# Altium project RK3566_.PrjPcb (part 3 of 6)

## Sheet WIFI_BT PHY.schdoc
size 297 x 209 mm; Symbol: Drawing-Symbol_A4; Company: 嘉立创EDA; Version: V1.0; Page Size: A4; @Project Name: RK3566; @Update Date: 2026-10-03; @Create Date: 2026-05-22; Device: Drawing-Symbol_A4; @Board Name: Board1; @Page Name: P2; @Create Time: 17:39:22; @Page Count: 4; @Page No: 4; @Schematic Name: Schematic1; @Update Time: 17:39:22; @Assembly Variant: Basic; Border: 1; Title Block Position: 3; Size: A4; Width: 1170; Height: 825; Region Start: 1; X Region Count: 6; Y Region Count: 4; Blade Width: 10; SheetNumber: 6; SheetTotal: 11
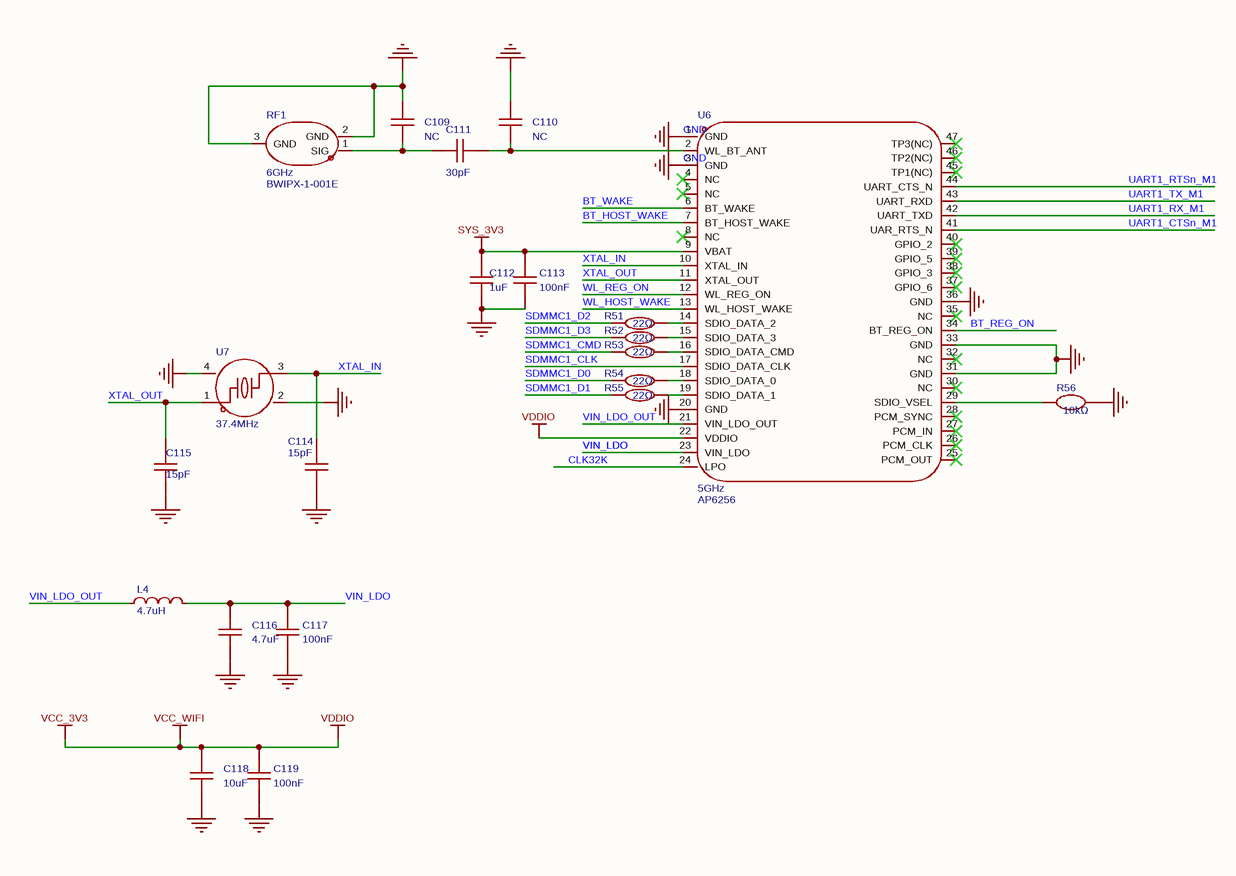
[diagram p6: WIFI_BT PHY.schdoc]

### Parts
C109  NC  [C0402]
C110  NC  [C0402]
C111  30pF  [C0402]
C112  1uF  [C0402]
C113  100nF  [C0402]
C114  15pF  [C0402]
C115  15pF  [C0402]
C116  4.7uF  [C0402]
C117  100nF  [C0402]
C118  10uF  [C0402]
C119  100nF  [C0402]
L4  4.7uH  [L0805]
R51  22Ω  [R0402]
R52  22Ω  [R0402]
R53  22Ω  [R0402]
R54  22Ω  [R0402]
R55  22Ω  [R0402]
R56  10kΩ  [R0402]
RF1  6GHz  [IPEX-SMD_BWIPX-1-001E]
U6  5GHz  [QFN-44_L12.0-W12.0-P0.90-TL_AP6256]
U7  37.4MHz  [OSC-SMD_4P-L1.6-W1.2-BL-1]

### Nets
GND: C109.2 C110.2 C112.1 C113.1 C114.1 C115.1 C116.1 C117.1 C118.1 C119.1 R56.2 RF1.2(GND) RF1.3(GND) U6.1(GND) U6.3(GND) U6.20(GND) U6.31(GND) U6.33(GND) U6.36(GND) U7.2(GND) U7.4(GND)  [project net AVSS1_1]
SYS_3V3: C112.2 C113.2 U6.9(VBAT)
VCC_3V3: C118.2 C119.2 U6.22(VDDIO)  [also labelled VCC_WIFI, VDDIO]  [project net SWOUT1]
BT_HOST_WAKE: U6.7(BT_HOST_WAKE)
BT_REG_ON: U6.34(BT_REG_ON)
BT_WAKE: U6.6(BT_WAKE)
CLK32K: U6.24(LPO)
SDMMC1_CLK: U6.17(SDIO_DATA_CLK)
SDMMC1_CMD: R53.1
SDMMC1_D0: R54.1
SDMMC1_D1: R55.1
SDMMC1_D2: R51.1
SDMMC1_D3: R52.1
UART1_CTSn_M1: U6.41(UAR_RTS_N)
UART1_RTSn_M1: U6.44(UART_CTS_N)
UART1_RX_M1: U6.42(UART_TXD)
UART1_TX_M1: U6.43(UART_RXD)
VIN_LDO: C116.2 C117.2 L4.2 U6.23(VIN_LDO)
VIN_LDO_OUT: L4.1 U6.21(VIN_LDO_OUT)
WL_HOST_WAKE: U6.13(WL_HOST_WAKE)
WL_REG_ON: U6.12(WL_REG_ON)
XTAL_IN: C114.2 U6.10(XTAL_IN) U7.3
XTAL_OUT: C115.2 U6.11(XTAL_OUT) U7.1
NetC109_1: C109.1 C111.1 RF1.1(SIG)
NetC110_1: C110.1 C111.2 U6.2(WL_BT_ANT)
NetR51_2: R51.2 U6.14(SDIO_DATA_2)
NetR52_2: R52.2 U6.15(SDIO_DATA_3)
NetR53_2: R53.2 U6.16(SDIO_DATA_CMD)
NetR54_2: R54.2 U6.18(SDIO_DATA_0)
NetR55_2: R55.2 U6.19(SDIO_DATA_1)
NetR56_1: R56.1 U6.29(SDIO_VSEL)

Not connected (* = marked no-connect by the designer): U6 4(NC)* 5(NC)* 8(NC)* 25(PCM_OUT)* 26(PCM_CLK)* 27(PCM_IN)* 28(PCM_SYNC)* 30(NC)* 32(NC)* 35(NC)* 37(GPIO_6)* 38(GPIO_3)* 39(GPIO_5)* 40(GPIO_2)* 45(TP1(NC))* 46(TP2(NC))* 47(TP3(NC))*

### Notes on the sheet
- 创建日期
- 2026-10-03
- 原理图
- 板子
- Schematic1
- Board1
- 更新日期
- 图页
- P2
- 绘制
- 审阅
- RK3566
- 版本
- V1.0
- 尺寸
- A4
- 页    4    共    4
- 嘉立创EDA

### Library data of the parts
C109 C110 = CC0402JRNPO9BN100: 容值:10pF;精度:±5%;额定电压:50V;温度系数:NP0;; Manufacturer: YAGEO(国巨); AddInBom: yes; ModelId: 36a51122f27c49738f86b3bfa98863e0聨0819f05c4eef4c71ace90d822a990e87; ModelName: C0402_L1.0-W0.5-H0.5; ModelTransform: 39.37,19.685,0,0,0,0,0,0,0; Tolerance: ±5%; Voltage Rating: 50V; Temperature Coefficient: NP0; Symbol: CC0402JRNPO9BN100; Device: CC0402JRNPO9BN100; Value: NC; LCSC Part Name: 10pF ±5% 50V; ManufacturerPart: CC0402JRNPO9BN100; Supplier Footprint: 0402; JLCPCB Part Class: Extended Part; Datasheet: https://item.szlcsc.com/datasheet/CC0402JRNPO9BN100/107414.html; Supplier: LCSC; ConvertToPcb: yes; FootprintName: C0402
C111 = CC0402FRNPO9BN300: 容值:30pF;精度:±1%;额定电压:50V;材质(温度系数):NP0;; Manufacturer: YAGEO(国巨); AddInBom: yes; ModelId: 36a51122f27c49738f86b3bfa98863e0聨0819f05c4eef4c71ace90d822a990e87; ModelName: C0402_L1.0-W0.5-H0.5; ModelTransform: 39.37,19.685,0,0,0,0,0,0,0; Tolerance: ±1%; Voltage Rated: 50V; Temperature Coefficient: NP0; Symbol: CC0402FRNPO9BN300; Device: CC0402FRNPO9BN300; LCSC Part Name: 30pF ±1% 50V; SupplierPart: C526980; ManufacturerPart: CC0402FRNPO9BN300; Supplier Footprint: 0402; JLCPCB Part Class: Extended Part; Datasheet: https://atta.szlcsc.com/upload/public/pdf/source/20200508/C526980_8BD9B2380CFF3BD9993DEB032B356E9B.pdf; Supplier: LCSC; ConvertToPcb: yes; FootprintName: C0402; Value: 30pF
C112 = HGC0402R5105K500NTEJ: 容值:1uF;精度:±10%;额定电压:50V;温度系数:X5R;; Manufacturer: Chinocera(华瓷); 3D Model: 36a51122f27c49738f86b3bfa98863e0聨0819f05c4eef4c71ace90d822a990e87; 3D Model Transform: 39.37,19.685,0,0,0,0,0,0,0; Tolerance: ±10%; Voltage Rating: 50V; Temperature Coefficient: X5R; AddInBom: yes; ModelName: C0402_L1.0-W0.5-H0.5; Symbol: HGC0402R5105K500NTEJ; Device: HGC0402R5105K500NTEJ; LCSC Part Name: 1uF ±10% 50V; Supplier Part: C7472948; Manufacturer Part: HGC0402R5105K500NTEJ; Supplier Footprint: 0402; JLCPCB Part Class: Extended Part; Datasheet: https://item.szlcsc.com/datasheet/HGC0402R5105K500NTEJ/8532795.html; Supplier: LCSC; Value: 1uF; ConvertToPcb: yes; FootprintName: C0402
C113 C117 C119 = CL05B104KO5NNNC: 容值:100nF;精度:±10%;额定电压:16V;温度系数:X7R;; Manufacturer: SAMSUNG(三星); 3D Model: 36a51122f27c49738f86b3bfa98863e0聨0819f05c4eef4c71ace90d822a990e87; 3D Model Transform: 39.37,19.685,0,0,0,0,0,0,0; Tolerance: ±10%; Voltage Rating: 16V; Temperature Coefficient: X7R; AddInBom: yes; ModelName: C0402_L1.0-W0.5-H0.5; Symbol: CL05B104KO5NNNC; Device: CL05B104KO5NNNC; LCSC Part Name: 100nF ±10% 16V; Supplier Part: C1525; Manufacturer Part: CL05B104KO5NNNC; Supplier Footprint: 0402; JLCPCB Part Class: Basic Part; Datasheet: https://item.szlcsc.com/datasheet/CL05B104KO5NNNC/1877.html; Supplier: LCSC; Value: 100nF; ConvertToPcb: yes; FootprintName: C0402
C114 C115 = CC0402FRNPO9BN150: 容值:15pF;精度:±1%;额定电压:50V;温度系数:NP0;; Manufacturer: YAGEO(国巨); AddInBom: yes; ModelId: 36a51122f27c49738f86b3bfa98863e0聨0819f05c4eef4c71ace90d822a990e87; ModelName: C0402_L1.0-W0.5-H0.5; ModelTransform: 39.37,19.685,0,0,0,0,0,0,0; Tolerance: ±1%; Voltage Rating: 50V; Temperature Coefficient: NP0; Symbol: CC0402FRNPO9BN150; Device: CC0402FRNPO9BN150; LCSC Part Name: 15pF ±1% 50V; SupplierPart: C326803; ManufacturerPart: CC0402FRNPO9BN150; Supplier Footprint: 0402; JLCPCB Part Class: Extended Part; Datasheet: https://item.szlcsc.com/datasheet/CC0402FRNPO9BN150/306897.html; Supplier: LCSC; ConvertToPcb: yes; FootprintName: C0402; Value: 15pF
C116 = CGA0402X5R475M250GT: 容值:4.7uF;精度:±20%;额定电压:25V;温度系数:X5R;; Manufacturer: HRE(芯声); AddInBom: yes; ModelId: 36a51122f27c49738f86b3bfa98863e0聨0819f05c4eef4c71ace90d822a990e87; ModelName: C0402_L1.0-W0.5-H0.5; ModelTransform: 39.37,19.685,0,0,0,0,0,0,0; Tolerance: ±20%; Voltage Rating: 25V; Temperature Coefficient: X5R; Symbol: CGA0402X5R475M250GT; Device: CGA0402X5R475M250GT; LCSC Part Name: 4.7uF ±20% 25V; SupplierPart: C6119795; ManufacturerPart: CGA0402X5R475M250GT; Supplier Footprint: 0402; JLCPCB Part Class: Extended Part; Datasheet: https://item.szlcsc.com/datasheet/CGA0402X5R475M250GT/7062501.html; Supplier: LCSC; ConvertToPcb: yes; FootprintName: C0402; Value: 4.7uF
C118 = HGC0402R5106M100NTEJ: 容值:10uF;精度:±20%;额定电压:10V;温度系数:X5R;; Manufacturer: Chinocera(华瓷); 3D Model: 36a51122f27c49738f86b3bfa98863e0聨0819f05c4eef4c71ace90d822a990e87; 3D Model Transform: 39.37,19.685,0,0,0,0,0,0,0; Tolerance: ±20%; Voltage Rating: 10V; Temperature Coefficient: X5R; AddInBom: yes; ModelName: C0402_L1.0-W0.5-H0.5; Symbol: HGC0402R5106M100NTEJ; Device: HGC0402R5106M100NTEJ; LCSC Part Name: 10uF ±20% 10V; Supplier Part: C7472949; Manufacturer Part: HGC0402R5106M100NTEJ; Supplier Footprint: 0402; JLCPCB Part Class: Extended Part; Datasheet: https://item.szlcsc.com/datasheet/HGC0402R5106M100NTEJ/8532796.html; Supplier: LCSC; Value: 10uF; ConvertToPcb: yes; FootprintName: C0402
L4 = MPL2012S4R7MHT: 电感值:4.7uH;精度:±20%;额定电流:800mA;类型:叠层电感;; Manufacturer: Sunlord(顺络); AddInBom: yes; ModelId: 37a81e68749a4138bd2dfa6897b24b85聨0819f05c4eef4c71ace90d822a990e87; ModelName: R0805_L2.0-W1.3-H0.6; ModelTransform: 78.74,51.181,0,0,0,0,0,0.001,0; Tolerance: ±20%; Current Rating: 800mA; DC Resistance(DCR): 250mΩ; Type: 叠层电感; Symbol: MPL2012S4R7MHT; Device: MPL2012S4R7MHT; LCSC Part Name: 4.7uH ±20%; SupplierPart: C63166; ManufacturerPart: MPL2012S4R7MHT; Supplier Footprint: 0805; JLCPCB Part Class: Extended Part; Datasheet: https://item.szlcsc.com/datasheet/MPL2012S4R7MHT/64229.html; Supplier: LCSC; ConvertToPcb: yes; FootprintName: L0805; Value: 4.7uH
R51-R55 = RC0402FR-0722RL: 电阻类型:厚膜电阻;阻值:22Ω;精度:±1%;功率:62.5mW;工作电压:50V;温度系数:±100ppm/℃;; Manufacturer: YAGEO(国巨); 3D Model: 98c88bc2b9094f218f3a3e30a7012738聨0819f05c4eef4c71ace90d822a990e87; 3D Model Transform: 39.37,19.685,0,0,0,0,0,0,0; Tolerance: ±1%; Power(Watts): 62.5mW; Voltage-Supply(Max): 50V; AddInBom: yes; ModelName: R0402_L1.0-W0.5-H0.4; Symbol: RC0402FR-0722RL; Device: RC0402FR-0722RL; LCSC Part Name: 厚膜电阻 22Ω ±1% 62.5mW; Supplier Part: C114765; Manufacturer Part: RC0402FR-0722RL; Supplier Footprint: 0402; JLCPCB Part Class: Extended Part; Datasheet: https://item.szlcsc.com/datasheet/RC0402FR-0722RL/116009.html; Supplier: LCSC; Type: 厚膜电阻; Value: 22Ω; Temperature Coefficient: ±100ppm/℃; Operating Temperature: -55℃~+155℃; ConvertToPcb: yes; FootprintName: R0402
R56 = FRC0402F1002TS: 电阻类型:厚膜电阻;阻值:10kΩ;精度:±1%;功率:62.5mW;工作电压:50V;温度系数:±100ppm/℃;; Manufacturer: FOJAN(富捷); AddInBom: yes; ModelId: 98c88bc2b9094f218f3a3e30a7012738聨0819f05c4eef4c71ace90d822a990e87; ModelName: R0402_L1.0-W0.5-H0.4; ModelTransform: 39.37,19.685,0,0,0,0,0,0,0; Tolerance: ±1%; Power(Watts): 62.5mW; Voltage-Supply(Max): 50V; Symbol: FRC0402F1002TS; Device: FRC0402F1002TS; LCSC Part Name: 10kΩ ±1% 62.5mW 厚膜电阻; SupplierPart: C2906861; ManufacturerPart: FRC0402F1002TS; Supplier Footprint: 0402; JLCPCB Part Class: Extended Part; Datasheet: https://item.szlcsc.com/datasheet/FRC0402F1002TS/3180374.html; Supplier: LCSC; ConvertToPcb: yes; FootprintName: R0402; Type: 厚膜电阻; Value: 10kΩ; Temperature Coefficient: ±100ppm/℃; Operating Temperature: -55℃~+155℃
RF1 = BWIPX-1-001E: 连接器类型:板端;接口类型:内针;端口数量:1;接口直径:2mm;接口长度/高度:1.25mm;频率:6GHz;射频系列:IPEX;阻抗:50Ω;样式:-;工作温度:-40℃~+85℃;; Manufacturer: BAT WIRELESS(蝙蝠无线); AddInBom: yes; ModelId: e9910d1cc3f644ef905f39c3184653d7聨0819f05c4eef4c71ace90d822a990e87; ModelTransform: 122.047,118.11,0,180,0,0,29.921,0,0; Connector Type: 板端; Interface: 内针; Number of Ports: 1; Interface Diameter: 2mm; Interface Length/Height: 1.25mm; RF Series: IPEX; Impedance: 50Ω; Symbol: BWIPX-1-001E; Device: BWIPX-1-001E; LCSC Part Name: 内针 IPEX; SupplierPart: C496552; ManufacturerPart: BWIPX-1-001E; Supplier Footprint: SMD; JLCPCB Part Class: Extended Part; Datasheet: https://item.szlcsc.com/datasheet/BWIPX-1-001E/508501.html; Supplier: LCSC; ConvertToPcb: yes; FootprintName: IPEX-SMD_BWIPX-1-001E; ModelName: IPEX-SMD_BWIPX-1-001E; Value: 6GHz; Style: -; Operating Temperature Range: -40℃~+85℃
U6 = AP6256: 核心芯片:BCM43456;频率:5GHz;发射功率:17dBm;接收灵敏度:-96dBm;; Manufacturer: AMPAK(正基科技); AddInBom: yes; Wireless Standard: IEEE802.11b/g/n；Bluetooth5.2; Interface Type: GPIO；PCM；SDIO；UART; Output Power: 17dBm; Voltage - Supply: 3.2V~4.8V; Sensitivity: -96dBm; Symbol: AP6256; Device: AP6256; LCSC Part Name: WIFI模块; SupplierPart: C5248079; ManufacturerPart: AP6256; Supplier Footprint: QFN-44(12x12); JLCPCB Part Class: Extended Part; Datasheet: https://item.szlcsc.com/datasheet/AP6256/5960630.html; Supplier: LCSC; ConvertToPcb: yes; FootprintName: QFN-44_L12.0-W12.0-P0.90-TL_AP6256; Utilized IC / Part: BCM43456; Value: 5GHz; Operating Temperature: -30℃~+85℃; Features: 集成蓝牙功能
U7 = SX16Y037400BC1T001: 晶振类型:贴片晶振;频率:37.4MHz;常温频差:±10ppm;负载电容:12pF;; Manufacturer: TKD(泰晶); AddInBom: yes; ModelId: b29ae56bafdc44b68620701fbba13e71聨0819f05c4eef4c71ace90d822a990e87; ModelTransform: 62.992,47.244,0,0,0,0,0,0,0; Normal temperature Frequency Tolerance: ±10ppm; Load Capacitance: 12pF; Equivalent Series Resistance(ESR): 60Ω; Symbol: SX16Y037400BC1T001; Device: SX16Y037400BC1T001; LCSC Part Name: 37.4MHz ±10ppm 12pF; SupplierPart: C20623632; ManufacturerPart: SX16Y037400BC1T001; Supplier Footprint: SMD1612-4P; JLCPCB Part Class: Extended Part; Datasheet: https://item.szlcsc.com/datasheet/SX16Y037400BC1T001/22021338.html; Supplier: LCSC; ConvertToPcb: yes; FootprintName: OSC-SMD_4P-L1.6-W1.2-BL-1; ModelName: OSC-SMD_4P-L1.6-W1.2-BL-1; Type: 贴片晶振; Value: 37.4MHz; Operating Temperature: -30℃~+85℃

## Sheet 板载电源.schdoc
size 420 x 297 mm; Symbol: Drawing-Symbol_A4; Company: 嘉立创EDA; Version: V1.0; Page Size: A4; @Project Name: RK3566; @Update Date: 2026-06-03; @Create Date: 2026-05-25; Device: Drawing-Symbol_A4; @Board Name: Board1; @Page Name: P1; @Create Time: 23:18:00; @Page Count: 1; @Page No: 1; @Schematic Name: Schematic1; @Update Time: 23:18:00; @Assembly Variant: Basic; Border: 1; Title Block Position: 3; Size: A4; Width: 1655; Height: 1170; Region Start: 1; X Region Count: 6; Y Region Count: 4; Blade Width: 10; SheetNumber: 7; SheetTotal: 11
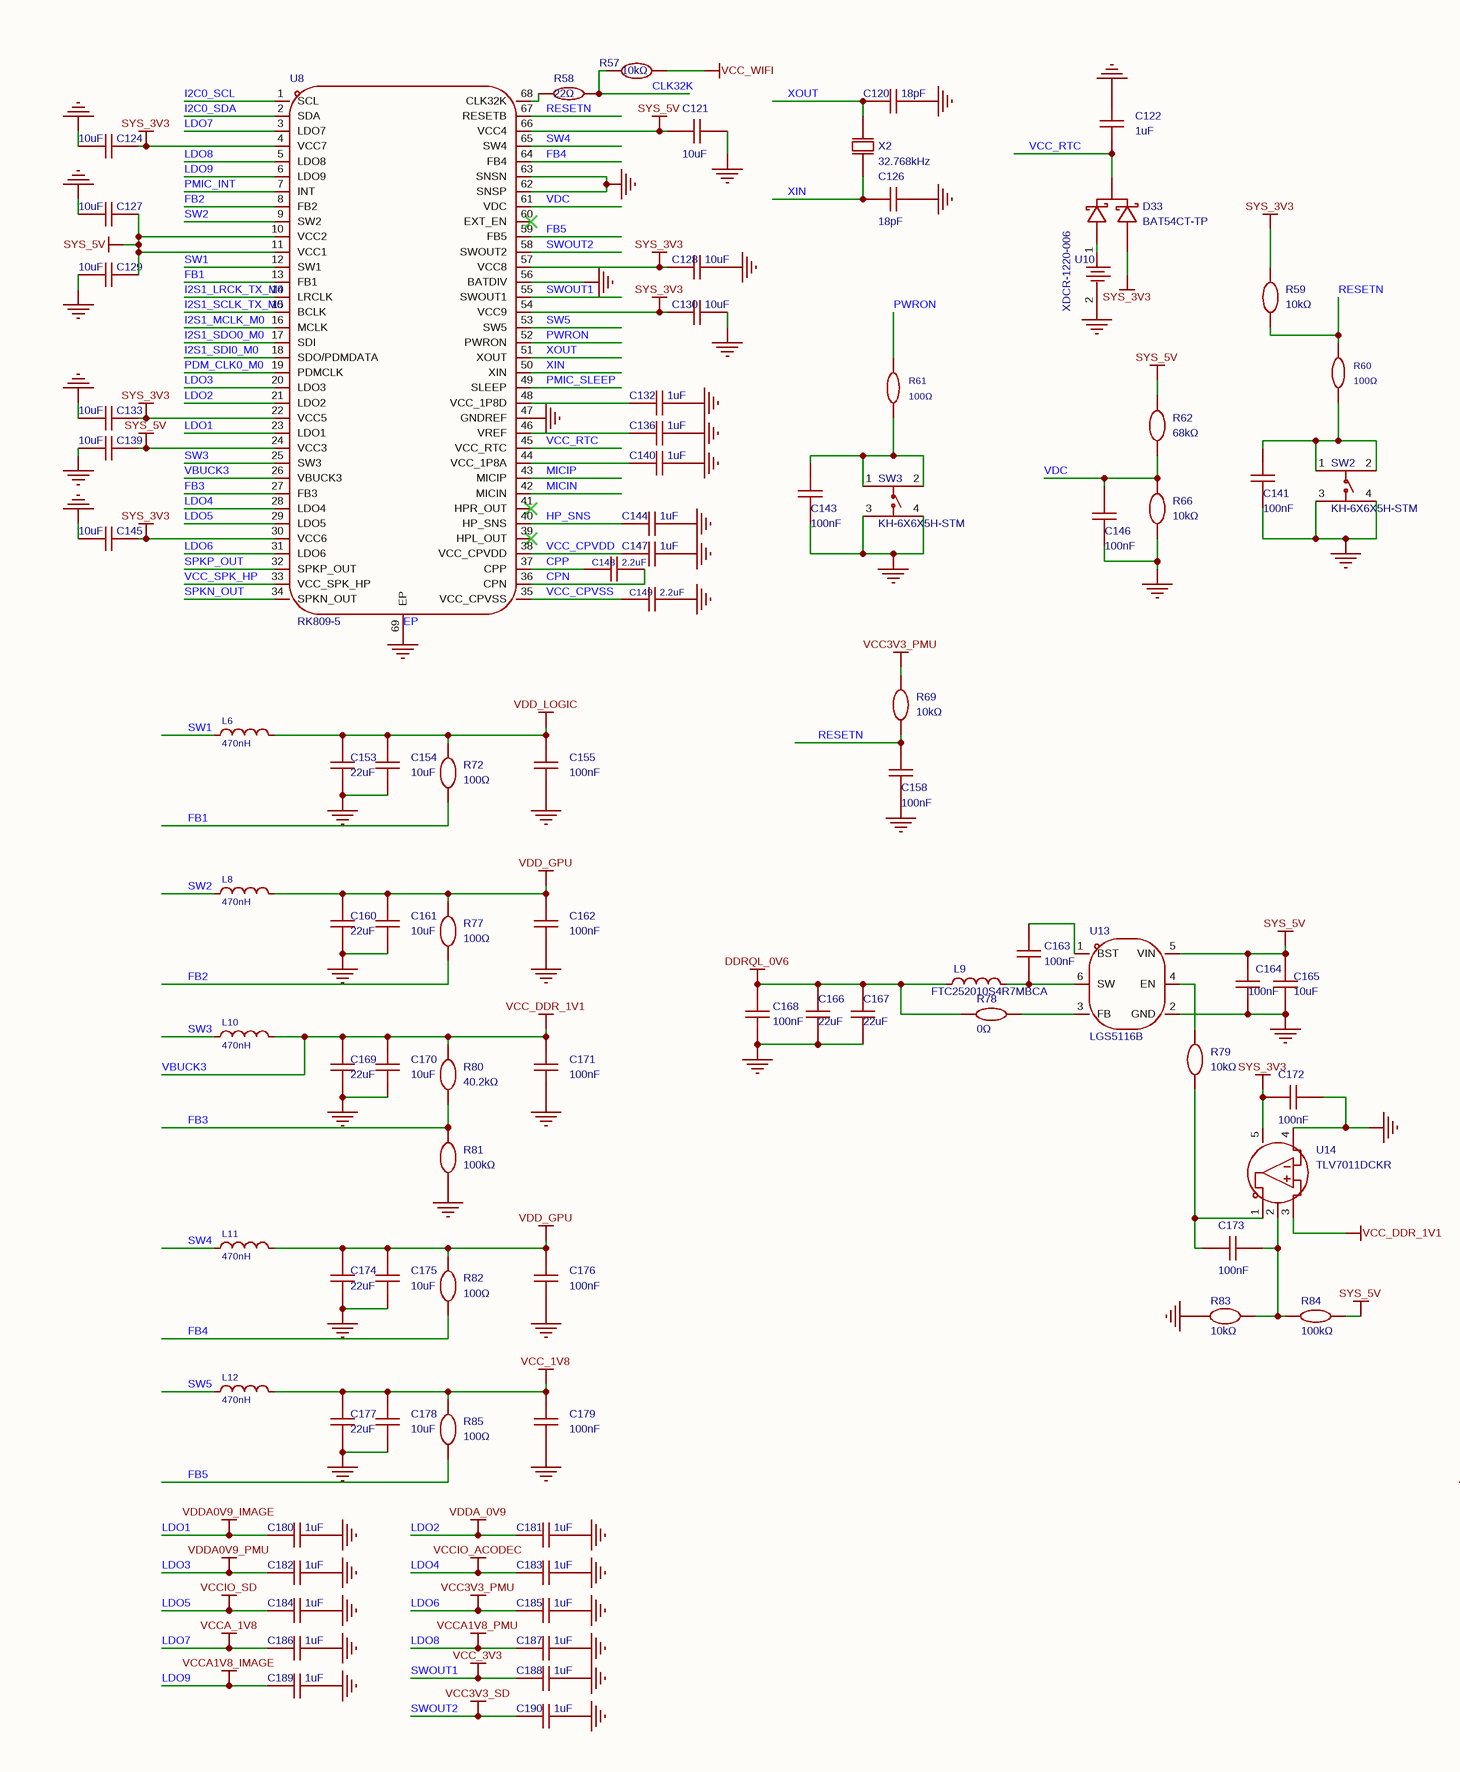
[diagram p7: 板载电源.schdoc, left]
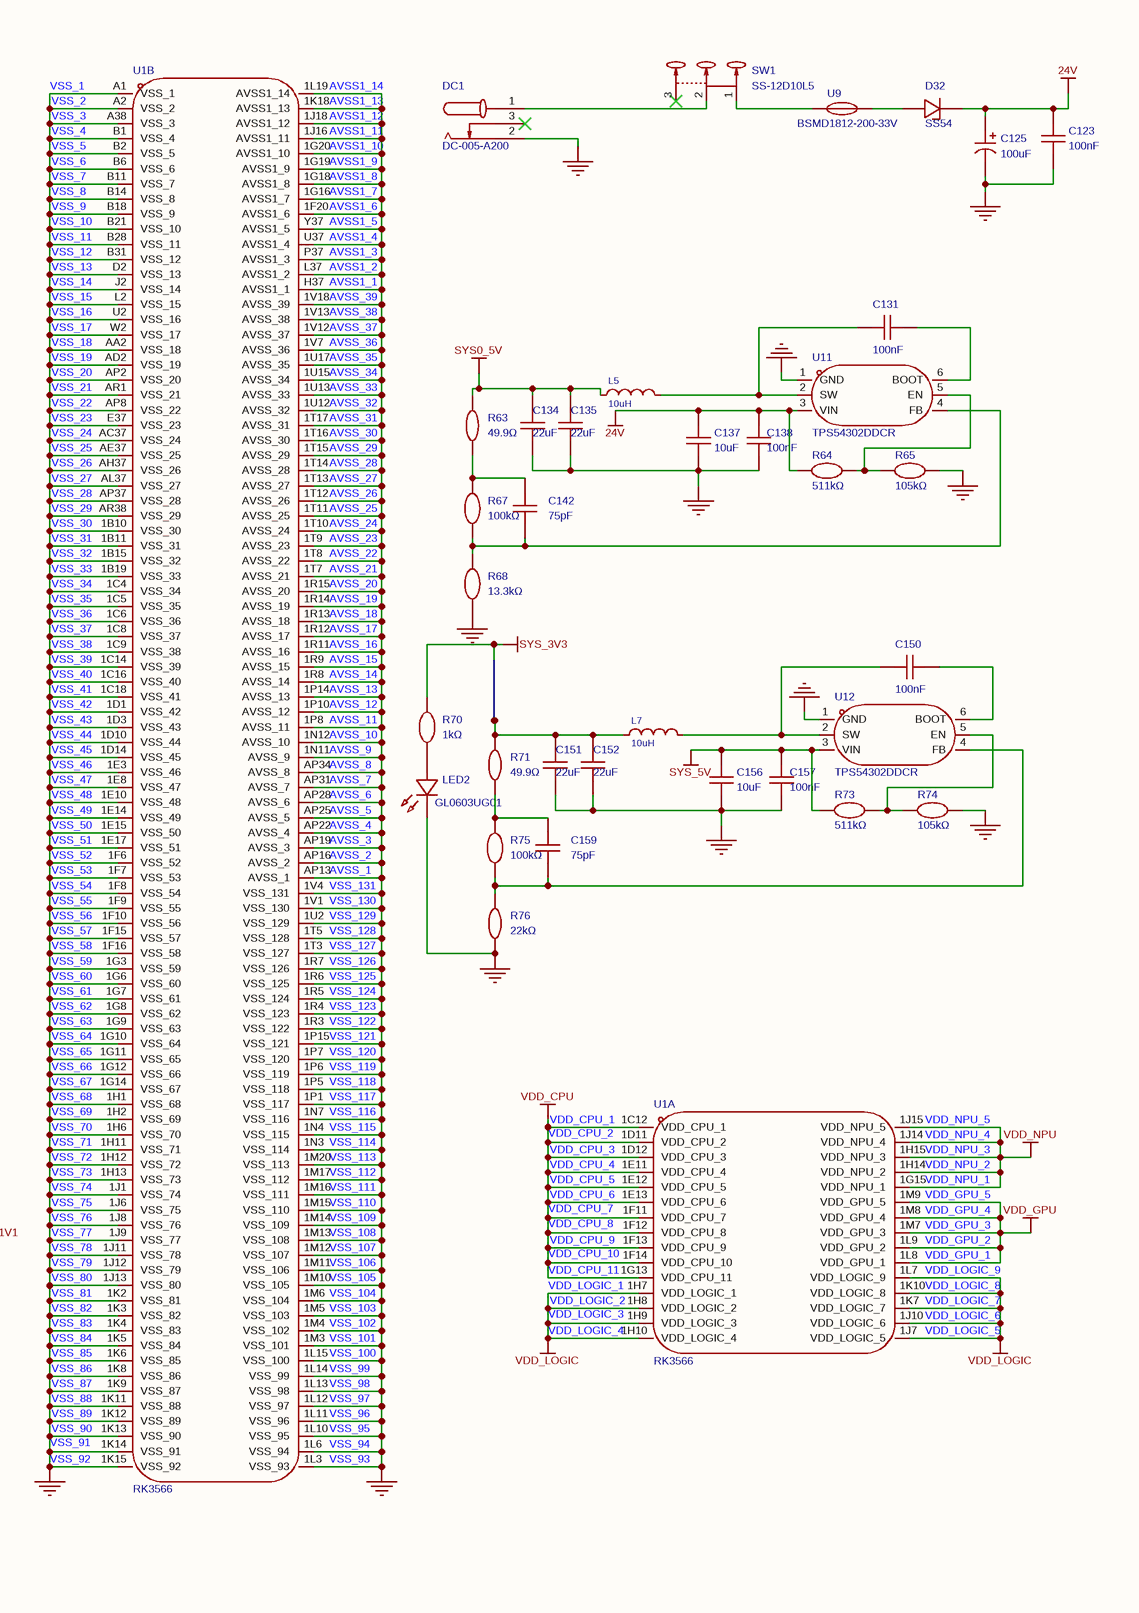
[diagram p8: 板载电源.schdoc, right]

### Parts
C120  18pF  [C0402]
C121  10uF  [C0402]
C122  1uF  [C0402]
C123  100nF  [C0603]
C124  10uF  [C0402]
C125  100uF  [CAP-SMD_BD6.3-L6.6-W6.6-LS7.6-FD-1]
C126  18pF  [C0402]
C127  10uF  [C0402]
C128  10uF  [C0402]
C129  10uF  [C0402]
C130  10uF  [C0402]
C131  100nF  [C0603]
C132  1uF  [C0402]
C133  10uF  [C0402]
C134  22uF  [C0603]
C135  22uF  [C0603]
C136  1uF  [C0402]
C137  10uF  [C0603]
C138  100nF  [C0603]
C139  10uF  [C0402]
C140  1uF  [C0402]
C141  100nF  [C0402]
C142  75pF  [C0603]
C143  100nF  [C0402]
C144  1uF  [C0402]
C145  10uF  [C0402]
C146  100nF  [C0402]
C147  1uF  [C0402]
C148  2.2uF  [C0402]
C149  2.2uF  [C0402]
C150  100nF  [C0603]
C151  22uF  [C0603]
C152  22uF  [C0603]
C153  22uF  [C0603]
C154  10uF  [C0402]
C155  100nF  [C0402]
C156  10uF  [C0603]
C157  100nF  [C0603]
C158  100nF  [C0402]
C159  75pF  [C0603]
C160  22uF  [C0603]
C161  10uF  [C0402]
C162  100nF  [C0402]
C163  100nF  [C0402]
C164  100nF  [C0402]
C165  10uF  [C0402]
C166  22uF  [C0603]
C167  22uF  [C0603]
C168  100nF  [C0402]
C169  22uF  [C0603]
C170  10uF  [C0402]
C171  100nF  [C0402]
C172  100nF  [C0402]
C173  100nF  [C0402]
C174  22uF  [C0603]
C175  10uF  [C0402]
C176  100nF  [C0402]
C177  22uF  [C0603]
C178  10uF  [C0402]
C179  100nF  [C0402]
C180  1uF  [C0402]
C181  1uF  [C0402]
C182  1uF  [C0402]
C183  1uF  [C0402]
C184  1uF  [C0402]
C185  1uF  [C0402]
C186  1uF  [C0402]
C187  1uF  [C0402]
C188  1uF  [C0402]
C189  1uF  [C0402]
C190  1uF  [C0402]
D32  SS54  [SMA_L4.3-W2.6-LS5.0-FD]
D33  BAT54CT-TP  [SOT-523-3_L1.6-W0.8-P1.00-LS1.6-BR]
DC1  DC-005-A200  [DC-IN-TH_DC-005-A200]
L5  10uH  [IND-SMD_L3.0-W3.0_MAI3015S]
L6  470nH  [IND-SMD_L2.0-W1.2_PCT201210]
L7  10uH  [IND-SMD_L3.0-W3.0_MAI3015S]
L8  470nH  [IND-SMD_L2.0-W1.2_PCT201210]
L9  FTC252010S4R7MBCA  [IND-SMD_L2.5-W2.0-VLS252012CX-150M]
L10  470nH  [IND-SMD_L2.0-W1.2_PCT201210]
L11  470nH  [IND-SMD_L2.0-W1.2_PCT201210]
L12  470nH  [IND-SMD_L2.0-W1.2_PCT201210]
LED2  GL0603UG01  [LED0603-RD]
R57  10kΩ  [R0402]
R58  22Ω  [R0402]
R59  10kΩ  [R0402]
R60  100Ω  [R0402]
R61  100Ω  [R0402]
R62  68kΩ  [R0402]
R63  49.9Ω  [R0603]
R64  511kΩ  [R0603]
R65  105kΩ  [R0603]
R66  10kΩ  [R0402]
R67  100kΩ  [R0603]
R68  13.3kΩ  [R0603]
R69  10kΩ  [R0402]
R70  1kΩ  [R0603]
R71  49.9Ω  [R0603]
R72  100Ω  [R0402]
R73  511kΩ  [R0603]
R74  105kΩ  [R0603]
R75  100kΩ  [R0603]
R76  22kΩ  [R0603]
R77  100Ω  [R0402]
R78  0Ω  [R0402]
R79  10kΩ  [R0402]
R80  40.2kΩ  [R0402]
R81  100kΩ  [R0402]
R82  100Ω  [R0402]
R83  10kΩ  [R0402]
R84  100kΩ  [R0402]
R85  100Ω  [R0402]
SW1  SS-12D10L5  [SW-TH_SS-12D10L5]
SW2  KH-6X6X5H-STM  [SW-SMD_4P-L6.0-W6.0-P4.50-LS9.0_H5.0]
SW3  KH-6X6X5H-STM  [SW-SMD_4P-L6.0-W6.0-P4.50-LS9.0_H5.0]
U1  RK3566  [BGA-565_L15.5-W14.4-P0.40_RK3566_1]  (parts A,B of 8)
U8  RK809-5  [QFN-68_L7.0-W7.0-P0.35-BL-EP5.5]
U9  BSMD1812-200-33V  [F1812]
U10  XDCR-1220-006  [BAT-SMD_CR1220-2ZX]
U11  TPS54302DDCR  [SOT-23-6_L2.9-W1.6-P0.95-LS2.8-BL]
U12  TPS54302DDCR  [SOT-23-6_L2.9-W1.6-P0.95-LS2.8-BL]
U13  LGS5116B  [SOT-23-6_L2.9-W1.6-P0.95-LS2.8-BR]
U14  TLV7011DCKR  [SC-70-5_L2.0-W1.3-P0.65-LS2.1-BL]
X2  32.768kHz  [CRYSTAL-SMD_2P-L2.0-W1.2]

### Nets
24V: C123.2 C125.1 C137.2 C138.2 D32.2(K) R64.1 U11.3(VIN)
AVSS1_1: C120.2 C121.1 C122.2 C123.1 C124.1 C125.2 C126.2 C127.1 C128.1 C129.1 C130.1 C132.2 C133.1 C134.1 C135.1 C136.2 C137.1 C138.1 C139.1 C140.2 C141.1 C143.1 C144.2 C145.1 C146.1 C147.2 C149.1 C151.1 C152.1 C153.1 C154.1 C155.1 C156.1 C157.1 C158.1 C160.1 C161.1 C162.1 C164.1 C165.1 C166.1 C167.1 C168.1 C169.1 C170.1 C171.1 C172.1 C174.1 C175.1 C176.1 C177.1 C178.1 C179.1 C180.2 C181.2 C182.2 C183.2 C184.2 C185.2 C186.2 C187.2 C188.2 C189.2 C190.2 DC1.2 LED2.1(K) R65.2 R66.1 R68.1 R74.2 R76.1 R81.1 R83.1 SW2.3 SW2.4 SW3.3 SW3.4 U1.1B10(VSS_30) U1.1B11(VSS_31) U1.1B15(VSS_32) U1.1B19(VSS_33) U1.1C4(VSS_34) U1.1C5(VSS_35) U1.1C6(VSS_36) U1.1C8(VSS_37) U1.1C9(VSS_38) U1.1C14(VSS_39) U1.1C16(VSS_40) U1.1C18(VSS_41) U1.1D1(VSS_42) U1.1D3(VSS_43) U1.1D10(VSS_44) U1.1D14(VSS_45) U1.1E3(VSS_46) U1.1E8(VSS_47) U1.1E10(VSS_48) U1.1E14(VSS_49) U1.1E15(VSS_50) U1.1E17(VSS_51) U1.1F6(VSS_52) U1.1F7(VSS_53) U1.1F8(VSS_54) U1.1F9(VSS_55) U1.1F10(VSS_56) U1.1F15(VSS_57) U1.1F16(VSS_58) U1.1F20(AVSS1_6) U1.1G3(VSS_59) U1.1G6(VSS_60) U1.1G7(VSS_61) U1.1G8(VSS_62) U1.1G9(VSS_63) U1.1G10(VSS_64) U1.1G11(VSS_65) U1.1G12(VSS_66) U1.1G14(VSS_67) U1.1G16(AVSS1_7) U1.1G18(AVSS1_8) U1.1G19(AVSS1_9) U1.1G20(AVSS1_10) U1.1H1(VSS_68) U1.1H2(VSS_69) U1.1H6(VSS_70) U1.1H11(VSS_71) U1.1H12(VSS_72) U1.1H13(VSS_73) U1.1J1(VSS_74) U1.1J6(VSS_75) U1.1J8(VSS_76) U1.1J9(VSS_77) U1.1J11(VSS_78) U1.1J12(VSS_79) U1.1J13(VSS_80) U1.1J16(AVSS1_11) U1.1J18(AVSS1_12) U1.1K2(VSS_81) U1.1K3(VSS_82) U1.1K4(VSS_83) U1.1K5(VSS_84) U1.1K6(VSS_85) U1.1K8(VSS_86) U1.1K9(VSS_87) U1.1K11(VSS_88) U1.1K12(VSS_89) U1.1K13(VSS_90) U1.1K14(VSS_91) U1.1K15(VSS_92) U1.1K18(AVSS1_13) U1.1L3(VSS_93) U1.1L6(VSS_94) U1.1L10(VSS_95) U1.1L11(VSS_96) U1.1L12(VSS_97) U1.1L13(VSS_98) U1.1L14(VSS_99) U1.1L15(VSS_100) U1.1L19(AVSS1_14) U1.1M3(VSS_101) U1.1M4(VSS_102) U1.1M5(VSS_103) U1.1M6(VSS_104) U1.1M10(VSS_105) U1.1M11(VSS_106) U1.1M12(VSS_107) U1.1M13(VSS_108) U1.1M14(VSS_109) U1.1M15(VSS_110) U1.1M16(VSS_111) U1.1M17(VSS_112) U1.1M20(VSS_113) U1.1N3(VSS_114) U1.1N4(VSS_115) U1.1N7(VSS_116) U1.1N11(AVSS_9) U1.1N12(AVSS_10) U1.1P1(VSS_117) U1.1P5(VSS_118) U1.1P6(VSS_119) U1.1P7(VSS_120) U1.1P8(AVSS_11) U1.1P10(AVSS_12) U1.1P14(AVSS_13) U1.1P15(VSS_121) U1.1R3(VSS_122) U1.1R4(VSS_123) U1.1R5(VSS_124) U1.1R6(VSS_125) U1.1R7(VSS_126) U1.1R8(AVSS_14) U1.1R9(AVSS_15) U1.1R11(AVSS_16) U1.1R12(AVSS_17) U1.1R13(AVSS_18) U1.1R14(AVSS_19) U1.1R15(AVSS_20) U1.1T3(VSS_127) U1.1T5(VSS_128) U1.1T7(AVSS_21) U1.1T8(AVSS_22) U1.1T9(AVSS_23) U1.1T10(AVSS_24) U1.1T11(AVSS_25) U1.1T12(AVSS_26) U1.1T13(AVSS_27) U1.1T14(AVSS_28) U1.1T15(AVSS_29) U1.1T16(AVSS_30) U1.1T17(AVSS_31) U1.1U2(VSS_129) U1.1U12(AVSS_32) U1.1U13(AVSS_33) U1.1U15(AVSS_34) U1.1U17(AVSS_35) U1.1V1(VSS_130) U1.1V4(VSS_131) U1.1V7(AVSS_36) U1.1V12(AVSS_37) U1.1V13(AVSS_38) U1.1V18(AVSS_39) U1.A1(VSS_1) U1.A2(VSS_2) U1.A38(VSS_3) U1.AA2(VSS_18) U1.AC37(VSS_24) U1.AD2(VSS_19) U1.AE37(VSS_25) U1.AH37(VSS_26) U1.AL37(VSS_27) U1.AP2(VSS_20) U1.AP8(VSS_22) U1.AP13(AVSS_1) U1.AP16(AVSS_2) U1.AP19(AVSS_3) U1.AP22(AVSS_4) U1.AP25(AVSS_5) U1.AP28(AVSS_6) U1.AP31(AVSS_7) U1.AP34(AVSS_8) U1.AP37(VSS_28) U1.AR1(VSS_21) U1.AR38(VSS_29) U1.B1(VSS_4) U1.B2(VSS_5) U1.B6(VSS_6) U1.B11(VSS_7) U1.B14(VSS_8) U1.B18(VSS_9) U1.B21(VSS_10) U1.B28(VSS_11) U1.B31(VSS_12) U1.D2(VSS_13) U1.E37(VSS_23) U1.H37(AVSS1_1) U1.J2(VSS_14) U1.L2(VSS_15) U1.L37(AVSS1_2) U1.P37(AVSS1_3) U1.U2(VSS_16) U1.U37(AVSS1_4) U1.W2(VSS_17) U1.Y37(AVSS1_5) U8.47(GNDREF) U8.56(BATDIV) U8.62(SNSP) U8.63(SNSN) U8.69(EP) U10.2 U11.1(GND) U12.1(GND) U13.2(GND) U14.4(IN-)  [also labelled AVSS1_10, AVSS1_11, AVSS1_12, AVSS1_13, AVSS1_14, AVSS1_2, AVSS1_3, AVSS1_4, AVSS1_5, AVSS1_6, AVSS1_7, AVSS1_8, AVSS1_9, AVSS_1, AVSS_10, AVSS_11, AVSS_12, AVSS_13, AVSS_14, AVSS_15, AVSS_16, AVSS_17, AVSS_18, AVSS_19, AVSS_2, AVSS_20, AVSS_21, AVSS_22, AVSS_23, AVSS_24, AVSS_25, AVSS_26, AVSS_27, AVSS_28, AVSS_29, AVSS_3, AVSS_30, AVSS_31, AVSS_32, AVSS_33, AVSS_34, AVSS_35, AVSS_36, AVSS_37, AVSS_38, AVSS_39, AVSS_4, AVSS_5, AVSS_6, AVSS_7, AVSS_8, AVSS_9, EP, GND, VSS_1, VSS_10, VSS_100, VSS_101, VSS_102, VSS_103, VSS_104, VSS_105, VSS_106, VSS_107, VSS_108, VSS_109, VSS_11, VSS_110, VSS_111, VSS_112, VSS_113, VSS_114, VSS_115, VSS_116, VSS_117, VSS_118, VSS_119, VSS_12, VSS_120, VSS_121, VSS_122, VSS_123, VSS_124, VSS_125, VSS_126, VSS_127, VSS_128, VSS_129, VSS_13, VSS_130, VSS_131, VSS_14, VSS_15, VSS_16, VSS_17, VSS_18, VSS_19, VSS_2, VSS_20, VSS_21, VSS_22, VSS_23, VSS_24, VSS_25, VSS_26, VSS_27, VSS_28, VSS_29, VSS_3, VSS_30, VSS_31, VSS_32, VSS_33, VSS_34, VSS_35, VSS_36, VSS_37, VSS_38, VSS_39, VSS_4, VSS_40, VSS_41, VSS_42, VSS_43, VSS_44, VSS_45, VSS_46, VSS_47, VSS_48, VSS_49, VSS_5, VSS_50, VSS_51, VSS_52, VSS_53, VSS_54, VSS_55, VSS_56, VSS_57, VSS_58, VSS_59, VSS_6, VSS_60, VSS_61, VSS_62, VSS_63, VSS_64, VSS_65, VSS_66, VSS_67, VSS_68, VSS_69, VSS_7, VSS_70, VSS_71, VSS_72, VSS_73, VSS_74, VSS_75, VSS_76, VSS_77, VSS_78, VSS_79, VSS_8, VSS_80, VSS_81, VSS_82, VSS_83, VSS_84, VSS_85, VSS_86, VSS_87, VSS_88, VSS_89, VSS_9, VSS_90, VSS_91, VSS_92, VSS_93, VSS_94, VSS_95, VSS_96, VSS_97, VSS_98, VSS_99]
DDRQL_0V6: C166.2 C167.2 C168.2 L9.1 R78.1  [project net VDDQ]
LDO1: C180.1 U8.23(LDO1)  [also labelled VDDA0V9_IMAGE]
LDO2: C181.1 U8.21(LDO2)  [also labelled VDDA_0V9]
LDO3: C182.1 U8.20(LDO3)  [also labelled VDDA0V9_PMU]
LDO4: C183.1 U8.28(LDO4)  [also labelled VCCIO_ACODEC]
LDO5: C184.1 U8.29(LDO5)  [also labelled VCCIO_SD]
LDO6: C185.1 R69.2 U8.31(LDO6)  [also labelled VCC3V3_PMU]
LDO7: C186.1 U8.3(LDO7)  [also labelled VCCA_1V8]
LDO8: C187.1 U8.5(LDO8)  [also labelled VCCA1V8_PMU]
LDO9: C189.1 U8.6(LDO9)  [also labelled VCCA1V8_IMAGE]
SWOUT1: C188.1 R57.2 U8.55(SWOUT1)  [also labelled VCC_3V3, VCC_WIFI]
SWOUT2: C190.1 U8.58(SWOUT2)  [also labelled VCC3V3_SD]
SYS0_5V: C134.2 C135.2 L5.1 R63.2
SYS_3V3: C124.2 C128.2 C130.2 C133.2 C145.2 C151.2 C152.2 C172.2 D33.2 L7.1 R59.2 R70.2 R71.2 U8.4(VCC7) U8.22(VCC5) U8.30(VCC6) U8.54(VCC9) U8.57(VCC8) U14.5(Vcc)
SYS_5V: C121.2 C127.2 C129.2 C139.2 C156.2 C157.2 C164.2 C165.2 R62.2 R73.1 R84.1 U8.10(VCC2) U8.11(VCC1) U8.24(VCC3) U8.66(VCC4) U12.3(VIN) U13.5(VIN)
VBUCK3: C169.2 C170.2 C171.2 L10.2 R80.2 U8.26(VBUCK3) U14.3(IN+)  [also labelled VCC_DDR_1V1]
VCC_1V8: C177.2 C178.2 C179.2 L12.2 R85.2
VDD_CPU_1: U1.1C12(VDD_CPU_1) U1.1D11(VDD_CPU_2) U1.1D12(VDD_CPU_3) U1.1E11(VDD_CPU_4) U1.1E12(VDD_CPU_5) U1.1E13(VDD_CPU_6) U1.1F11(VDD_CPU_7) U1.1F12(VDD_CPU_8) U1.1F13(VDD_CPU_9) U1.1F14(VDD_CPU_10) U1.1G13(VDD_CPU_11)  [also labelled VDD_CPU, VDD_CPU_10, VDD_CPU_11, VDD_CPU_2, VDD_CPU_3, VDD_CPU_4, VDD_CPU_5, VDD_CPU_6, VDD_CPU_7, VDD_CPU_8, VDD_CPU_9]
VDD_GPU_1: C160.2 C161.2 C162.2 C174.2 C175.2 C176.2 L8.2 L11.2 R77.2 R82.2 U1.1L8(VDD_GPU_1) U1.1L9(VDD_GPU_2) U1.1M7(VDD_GPU_3) U1.1M8(VDD_GPU_4) U1.1M9(VDD_GPU_5)  [also labelled VDD_GPU, VDD_GPU_2, VDD_GPU_3, VDD_GPU_4, VDD_GPU_5]
VDD_LOGIC_1: C153.2 C154.2 C155.2 L6.2 R72.2 U1.1H7(VDD_LOGIC_1) U1.1H8(VDD_LOGIC_2) U1.1H9(VDD_LOGIC_3) U1.1H10(VDD_LOGIC_4) U1.1J7(VDD_LOGIC_5) U1.1J10(VDD_LOGIC_6) U1.1K7(VDD_LOGIC_7) U1.1K10(VDD_LOGIC_8) U1.1L7(VDD_LOGIC_9)  [also labelled VDD_LOGIC, VDD_LOGIC_2, VDD_LOGIC_3, VDD_LOGIC_4, VDD_LOGIC_5, VDD_LOGIC_6, VDD_LOGIC_7, VDD_LOGIC_8, VDD_LOGIC_9]
VDD_NPU_1: U1.1G15(VDD_NPU_1) U1.1H14(VDD_NPU_2) U1.1H15(VDD_NPU_3) U1.1J14(VDD_NPU_4) U1.1J15(VDD_NPU_5)  [also labelled VDD_NPU, VDD_NPU_2, VDD_NPU_3, VDD_NPU_4, VDD_NPU_5]
CLK32K: R57.1 R58.2
CPN: C148.1 U8.36(CPN)
CPP: C148.2 U8.37(CPP)
FB1: R72.1 U8.13(FB1)
FB2: R77.1 U8.8(FB2)
FB3: R80.1 R81.2 U8.27(FB3)
FB4: R82.1 U8.64(FB4)
FB5: R85.1 U8.59(FB5)
HP_SNS: C144.1 U8.40(HP_SNS)
I2C0_SCL: U8.1(SCL)
I2C0_SDA: U8.2(SDA)
I2S1_LRCK_TX_M0: U8.14(LRCLK)
I2S1_MCLK_M0: U8.16(MCLK)
I2S1_SCLK_TX_M0: U8.15(BCLK)
I2S1_SDI0_M0: U8.18(SDO/PDMDATA)
I2S1_SDO0_M0: U8.17(SDI)
MICIN: U8.42(MICIN)
MICIP: U8.43(MICIP)
PDM_CLK0_M0: U8.19(PDMCLK)
PMIC_INT: U8.7(INT)
PMIC_SLEEP: U8.49(SLEEP)
PWRON: R61.2 U8.52(PWRON)
RESETN: C158.2 R59.1 R60.2 R69.1 U8.67(RESETB)
SPKN_OUT: U8.34(SPKN_OUT)
SPKP_OUT: U8.32(SPKP_OUT)
SW1: L6.1 U8.12(SW1)
SW2: L8.1 U8.9(SW2)
SW3: L10.1 U8.25(SW3)
SW4: L11.1 U8.65(SW4)
SW5: L12.1 U8.53(SW5)
VCC_CPVDD: C147.1 U8.38(VCC_CPVDD)
VCC_CPVSS: C149.2 U8.35(VCC_CPVSS)
VCC_RTC: C122.1 D33.3 U8.45(VCC_RTC)
VCC_SPK_HP: U8.33(VCC_SPK_HP)
VDC: C146.2 R62.1 R66.2 U8.61(VDC)
XIN: C126.1 U8.50(XIN) X2.1(OSC1)
XOUT: C120.1 U8.51(XOUT) X2.2(OSC2)
NetC131_1: C131.1 L5.2 U11.2(SW)
NetC131_2: C131.2 U11.6(BOOT)
NetC132_1: C132.1 U8.48(VCC_1P8D)
NetC136_1: C136.1 U8.46(VREF)
NetC140_1: C140.1 U8.44(VCC_1P8A)
NetC141_2: C141.2 R60.1 SW2.1 SW2.2
NetC142_1: C142.1 R63.1 R67.2
NetC142_2: C142.2 R67.1 R68.2 U11.4(FB)
NetC143_2: C143.2 R61.1 SW3.1 SW3.2
NetC150_1: C150.1 L7.2 U12.2(SW)
NetC150_2: C150.2 U12.6(BOOT)
NetC159_1: C159.1 R71.1 R75.2
NetC159_2: C159.2 R75.1 R76.2 U12.4(FB)
NetC163_1: C163.1 L9.2 U13.6(SW)
NetC163_2: C163.2 U13.1(BST)
NetC173_1: C173.1 R83.2 R84.2 U14.2(Vee)
NetC173_2: C173.2 R79.1 U14.1(OUT)
NetD32_1: D32.1(A) U9.2
NetD33_1: D33.1 U10.1
NetDC1_1: DC1.1 SW1.2
NetLED2_2: LED2.2(A) R70.1
NetR58_1: R58.1 U8.68(CLK32K)
NetR64_2: R64.2 R65.1 U11.5(EN)
NetR73_2: R73.2 R74.1 U12.5(EN)
NetR78_2: R78.2 U13.3(FB)
NetR79_2: R79.2 U13.4(EN)
NetSW1_1: SW1.1 U9.1

Not connected (* = marked no-connect by the designer): DC1 3*; SW1 3*; U8 39(HPL_OUT)* 41(HPR_OUT)* 60(EXT_EN)*

### Notes on the sheet
- 创建日期
- 2026-03-08
- 原理图
- 板子
- Schematic1
- Board1
- 更新日期
- 图页
- P1
- 绘制
- 审阅
- RK3566
- 版本
- V1.0
- 尺寸
- A4
- 页    1    共    1
- 嘉立创EDA